# Vivado block design aurora_gty_vu13pto47dr, xcvu13p-fhgb2104-2-i, Vivado 2025.2
# (continued, part 2 of 4)
current_bd_instance /link_x1y4

create_bd_cell -type ip -vlnv xilinx.com:ip:axis_data_fifo:2.0 rx_fifo_c0
set_property -dict [list \
  CONFIG.HAS_AFULL 1 \
  CONFIG.HAS_TLAST 1 \
  CONFIG.HAS_WR_DATA_COUNT 1 \
  CONFIG.IS_ACLK_ASYNC 1 \
] [get_bd_cells rx_fifo_c0]
create_bd_cell -type ip -vlnv xilinx.com:ip:axis_data_fifo:2.0 rx_fifo_c1
set_property -dict [list \
  CONFIG.HAS_AFULL 1 \
  CONFIG.HAS_TLAST 1 \
  CONFIG.HAS_WR_DATA_COUNT 1 \
  CONFIG.IS_ACLK_ASYNC 1 \
] [get_bd_cells rx_fifo_c1]
create_bd_cell -type ip -vlnv xilinx.com:ip:axis_data_fifo:2.0 tx_fifo_c0
set_property -dict [list \
  CONFIG.HAS_AFULL 1 \
  CONFIG.HAS_TLAST 1 \
  CONFIG.HAS_WR_DATA_COUNT 1 \
  CONFIG.IS_ACLK_ASYNC 1 \
  CONFIG.TDATA_NUM_BYTES 16 \
] [get_bd_cells tx_fifo_c0]
create_bd_cell -type ip -vlnv xilinx.com:ip:axis_data_fifo:2.0 tx_fifo_c1
set_property -dict [list \
  CONFIG.HAS_AFULL 1 \
  CONFIG.HAS_TLAST 1 \
  CONFIG.HAS_WR_DATA_COUNT 1 \
  CONFIG.IS_ACLK_ASYNC 1 \
  CONFIG.TDATA_NUM_BYTES 16 \
] [get_bd_cells tx_fifo_c1]
create_bd_cell -type ip -vlnv xilinx.com:ip:axis_register_slice:1.1 tx_slice_c0
set_property -dict [list \
  CONFIG.NUM_SLR_CROSSINGS 2 \
  CONFIG.PIPELINES_MASTER 1 \
  CONFIG.PIPELINES_MIDDLE 1 \
  CONFIG.PIPELINES_SLAVE 1 \
  CONFIG.REG_CONFIG 15 \
] [get_bd_cells tx_slice_c0]
create_bd_cell -type ip -vlnv xilinx.com:ip:axis_register_slice:1.1 tx_slice_c1
set_property -dict [list \
  CONFIG.NUM_SLR_CROSSINGS 2 \
  CONFIG.PIPELINES_MASTER 1 \
  CONFIG.PIPELINES_MIDDLE 1 \
  CONFIG.PIPELINES_SLAVE 1 \
  CONFIG.REG_CONFIG 15 \
] [get_bd_cells tx_slice_c1]
create_bd_cell -type ip -vlnv xilinx.com:ip:axis_register_slice:1.1 rx_slice_c0
create_bd_cell -type ip -vlnv xilinx.com:ip:axis_register_slice:1.1 rx_slice_c1
create_bd_cell -type ip -vlnv xilinx.com:ip:xpm_cdc_gen:1.0 axis_rst_sync_c0
set_property -dict {CONFIG.CDC_TYPE xpm_cdc_async_rst} [get_bd_cells axis_rst_sync_c0]
create_bd_cell -type ip -vlnv xilinx.com:ip:xpm_cdc_gen:1.0 axis_rst_sync_c1
set_property -dict {CONFIG.CDC_TYPE xpm_cdc_async_rst} [get_bd_cells axis_rst_sync_c1]
create_bd_cell -type ip -vlnv xilinx.com:ip:xpm_cdc_gen:1.0 user_rst_sync_c1
set_property -dict {CONFIG.CDC_TYPE xpm_cdc_async_rst} [get_bd_cells user_rst_sync_c1]
create_bd_cell -type ip -vlnv xilinx.com:ip:xpm_cdc_gen:1.0 user_rst_sync_c0
set_property -dict {CONFIG.CDC_TYPE xpm_cdc_async_rst} [get_bd_cells user_rst_sync_c0]

# ---- hierarchy /link_x1y5 ----
current_bd_instance /link_x1y5
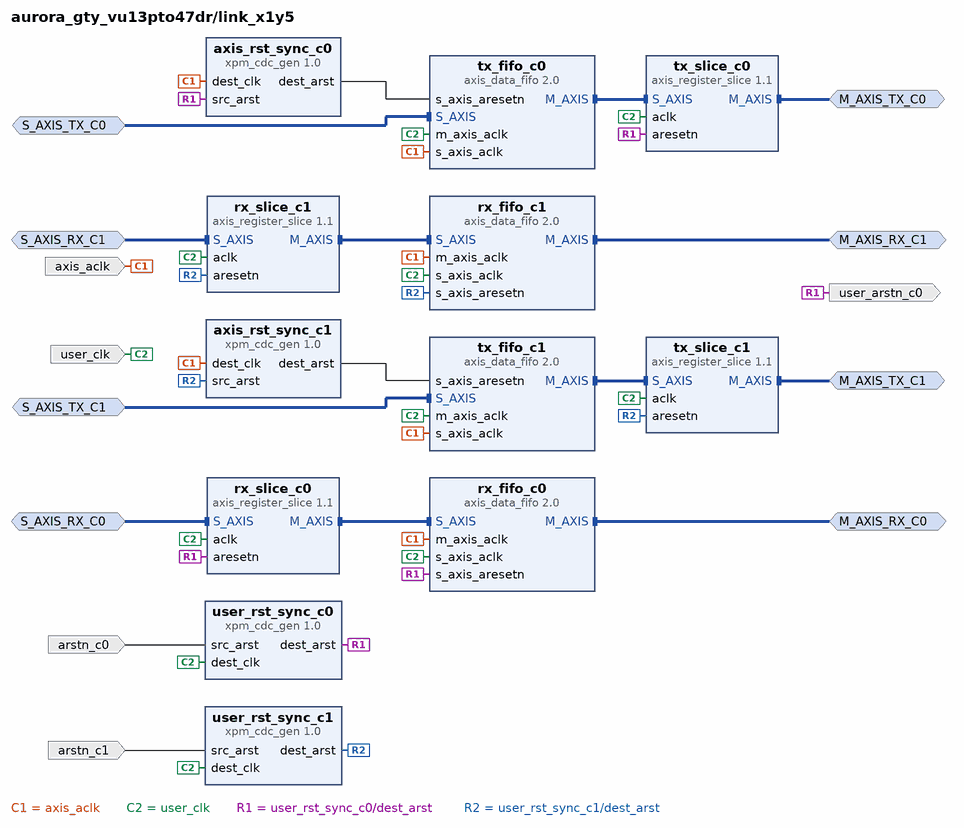
[diagram p10: block diagram inside /link_x1y5]
create_bd_intf_pin -mode Master -vlnv xilinx.com:interface:axis_rtl:1.0 M_AXIS_RX_C0
create_bd_intf_pin -mode Master -vlnv xilinx.com:interface:axis_rtl:1.0 M_AXIS_RX_C1
create_bd_intf_pin -mode Slave -vlnv xilinx.com:interface:axis_rtl:1.0 S_AXIS_TX_C0
create_bd_intf_pin -mode Slave -vlnv xilinx.com:interface:axis_rtl:1.0 S_AXIS_TX_C1
create_bd_intf_pin -mode Master -vlnv xilinx.com:interface:axis_rtl:1.0 M_AXIS_TX_C0
create_bd_intf_pin -mode Master -vlnv xilinx.com:interface:axis_rtl:1.0 M_AXIS_TX_C1
create_bd_intf_pin -mode Slave -vlnv xilinx.com:interface:axis_rtl:1.0 S_AXIS_RX_C0
create_bd_intf_pin -mode Slave -vlnv xilinx.com:interface:axis_rtl:1.0 S_AXIS_RX_C1
create_bd_pin -dir O user_arstn_c0
create_bd_pin -dir I -type clk user_clk
create_bd_pin -dir I -type clk axis_aclk
create_bd_pin -dir I arstn_c1
create_bd_pin -dir I arstn_c0

create_bd_cell -type ip -vlnv xilinx.com:ip:axis_data_fifo:2.0 rx_fifo_c0
set_property -dict [list \
  CONFIG.HAS_AFULL 1 \
  CONFIG.HAS_TLAST 1 \
  CONFIG.HAS_WR_DATA_COUNT 1 \
  CONFIG.IS_ACLK_ASYNC 1 \
] [get_bd_cells rx_fifo_c0]
create_bd_cell -type ip -vlnv xilinx.com:ip:axis_data_fifo:2.0 rx_fifo_c1
set_property -dict [list \
  CONFIG.HAS_AFULL 1 \
  CONFIG.HAS_TLAST 1 \
  CONFIG.HAS_WR_DATA_COUNT 1 \
  CONFIG.IS_ACLK_ASYNC 1 \
] [get_bd_cells rx_fifo_c1]
create_bd_cell -type ip -vlnv xilinx.com:ip:axis_data_fifo:2.0 tx_fifo_c0
set_property -dict [list \
  CONFIG.HAS_AFULL 1 \
  CONFIG.HAS_TLAST 1 \
  CONFIG.HAS_WR_DATA_COUNT 1 \
  CONFIG.IS_ACLK_ASYNC 1 \
  CONFIG.TDATA_NUM_BYTES 16 \
] [get_bd_cells tx_fifo_c0]
create_bd_cell -type ip -vlnv xilinx.com:ip:axis_data_fifo:2.0 tx_fifo_c1
set_property -dict [list \
  CONFIG.HAS_AFULL 1 \
  CONFIG.HAS_TLAST 1 \
  CONFIG.HAS_WR_DATA_COUNT 1 \
  CONFIG.IS_ACLK_ASYNC 1 \
  CONFIG.TDATA_NUM_BYTES 16 \
] [get_bd_cells tx_fifo_c1]
create_bd_cell -type ip -vlnv xilinx.com:ip:axis_register_slice:1.1 tx_slice_c0
set_property -dict [list \
  CONFIG.NUM_SLR_CROSSINGS 2 \
  CONFIG.PIPELINES_MASTER 1 \
  CONFIG.PIPELINES_MIDDLE 1 \
  CONFIG.PIPELINES_SLAVE 1 \
  CONFIG.REG_CONFIG 15 \
] [get_bd_cells tx_slice_c0]
create_bd_cell -type ip -vlnv xilinx.com:ip:axis_register_slice:1.1 tx_slice_c1
set_property -dict [list \
  CONFIG.NUM_SLR_CROSSINGS 2 \
  CONFIG.PIPELINES_MASTER 1 \
  CONFIG.PIPELINES_MIDDLE 1 \
  CONFIG.PIPELINES_SLAVE 1 \
  CONFIG.REG_CONFIG 15 \
] [get_bd_cells tx_slice_c1]
create_bd_cell -type ip -vlnv xilinx.com:ip:axis_register_slice:1.1 rx_slice_c0
create_bd_cell -type ip -vlnv xilinx.com:ip:axis_register_slice:1.1 rx_slice_c1
create_bd_cell -type ip -vlnv xilinx.com:ip:xpm_cdc_gen:1.0 axis_rst_sync_c0
set_property -dict {CONFIG.CDC_TYPE xpm_cdc_async_rst} [get_bd_cells axis_rst_sync_c0]
create_bd_cell -type ip -vlnv xilinx.com:ip:xpm_cdc_gen:1.0 axis_rst_sync_c1
set_property -dict {CONFIG.CDC_TYPE xpm_cdc_async_rst} [get_bd_cells axis_rst_sync_c1]
create_bd_cell -type ip -vlnv xilinx.com:ip:xpm_cdc_gen:1.0 user_rst_sync_c1
set_property -dict {CONFIG.CDC_TYPE xpm_cdc_async_rst} [get_bd_cells user_rst_sync_c1]
create_bd_cell -type ip -vlnv xilinx.com:ip:xpm_cdc_gen:1.0 user_rst_sync_c0
set_property -dict {CONFIG.CDC_TYPE xpm_cdc_async_rst} [get_bd_cells user_rst_sync_c0]

# ---- hierarchy /link_x1y6 ----
current_bd_instance /link_x1y6
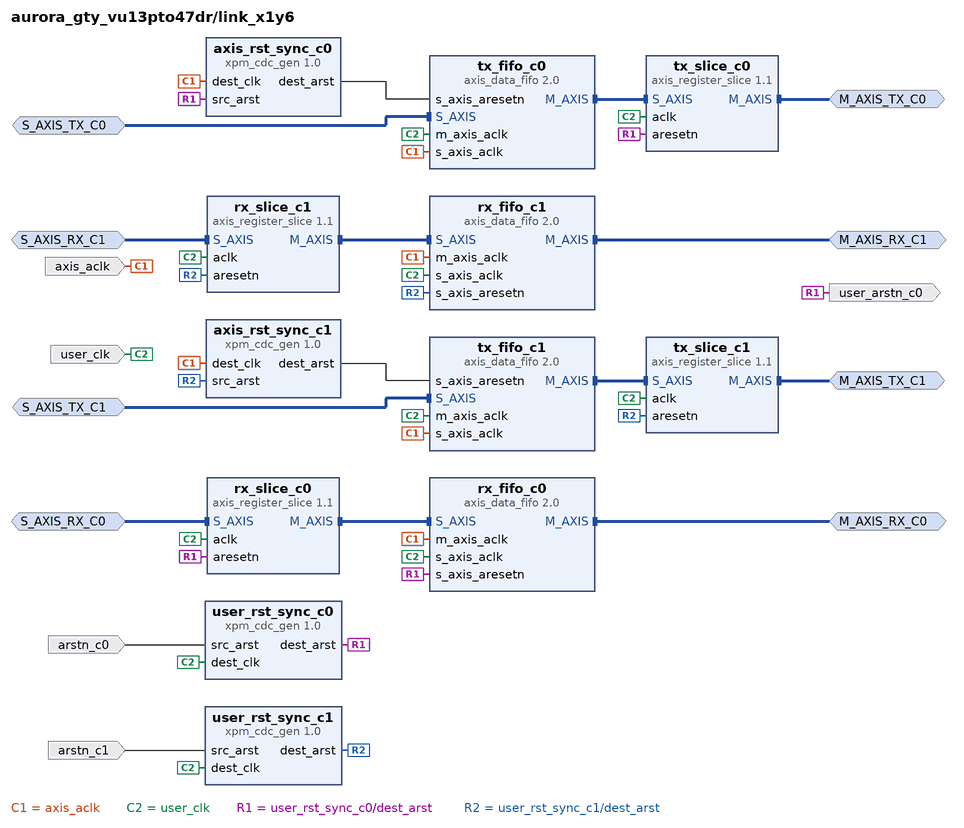
[diagram p11: block diagram inside /link_x1y6]
create_bd_intf_pin -mode Master -vlnv xilinx.com:interface:axis_rtl:1.0 M_AXIS_RX_C0
create_bd_intf_pin -mode Master -vlnv xilinx.com:interface:axis_rtl:1.0 M_AXIS_RX_C1
create_bd_intf_pin -mode Slave -vlnv xilinx.com:interface:axis_rtl:1.0 S_AXIS_TX_C0
create_bd_intf_pin -mode Slave -vlnv xilinx.com:interface:axis_rtl:1.0 S_AXIS_TX_C1
create_bd_intf_pin -mode Master -vlnv xilinx.com:interface:axis_rtl:1.0 M_AXIS_TX_C0
create_bd_intf_pin -mode Master -vlnv xilinx.com:interface:axis_rtl:1.0 M_AXIS_TX_C1
create_bd_intf_pin -mode Slave -vlnv xilinx.com:interface:axis_rtl:1.0 S_AXIS_RX_C0
create_bd_intf_pin -mode Slave -vlnv xilinx.com:interface:axis_rtl:1.0 S_AXIS_RX_C1
create_bd_pin -dir O user_arstn_c0
create_bd_pin -dir I -type clk user_clk
create_bd_pin -dir I -type clk axis_aclk
create_bd_pin -dir I arstn_c1
create_bd_pin -dir I arstn_c0

create_bd_cell -type ip -vlnv xilinx.com:ip:axis_data_fifo:2.0 rx_fifo_c0
set_property -dict [list \
  CONFIG.HAS_AFULL 1 \
  CONFIG.HAS_TLAST 1 \
  CONFIG.HAS_WR_DATA_COUNT 1 \
  CONFIG.IS_ACLK_ASYNC 1 \
] [get_bd_cells rx_fifo_c0]
create_bd_cell -type ip -vlnv xilinx.com:ip:axis_data_fifo:2.0 rx_fifo_c1
set_property -dict [list \
  CONFIG.HAS_AFULL 1 \
  CONFIG.HAS_TLAST 1 \
  CONFIG.HAS_WR_DATA_COUNT 1 \
  CONFIG.IS_ACLK_ASYNC 1 \
] [get_bd_cells rx_fifo_c1]
create_bd_cell -type ip -vlnv xilinx.com:ip:axis_data_fifo:2.0 tx_fifo_c0
set_property -dict [list \
  CONFIG.HAS_AFULL 1 \
  CONFIG.HAS_TLAST 1 \
  CONFIG.HAS_WR_DATA_COUNT 1 \
  CONFIG.IS_ACLK_ASYNC 1 \
  CONFIG.TDATA_NUM_BYTES 16 \
] [get_bd_cells tx_fifo_c0]
create_bd_cell -type ip -vlnv xilinx.com:ip:axis_data_fifo:2.0 tx_fifo_c1
set_property -dict [list \
  CONFIG.HAS_AFULL 1 \
  CONFIG.HAS_TLAST 1 \
  CONFIG.HAS_WR_DATA_COUNT 1 \
  CONFIG.IS_ACLK_ASYNC 1 \
  CONFIG.TDATA_NUM_BYTES 16 \
] [get_bd_cells tx_fifo_c1]
create_bd_cell -type ip -vlnv xilinx.com:ip:axis_register_slice:1.1 tx_slice_c0
set_property -dict [list \
  CONFIG.NUM_SLR_CROSSINGS 2 \
  CONFIG.PIPELINES_MASTER 1 \
  CONFIG.PIPELINES_MIDDLE 1 \
  CONFIG.PIPELINES_SLAVE 1 \
  CONFIG.REG_CONFIG 15 \
] [get_bd_cells tx_slice_c0]
create_bd_cell -type ip -vlnv xilinx.com:ip:axis_register_slice:1.1 tx_slice_c1
set_property -dict [list \
  CONFIG.NUM_SLR_CROSSINGS 2 \
  CONFIG.PIPELINES_MASTER 1 \
  CONFIG.PIPELINES_MIDDLE 1 \
  CONFIG.PIPELINES_SLAVE 1 \
  CONFIG.REG_CONFIG 15 \
] [get_bd_cells tx_slice_c1]
create_bd_cell -type ip -vlnv xilinx.com:ip:axis_register_slice:1.1 rx_slice_c0
create_bd_cell -type ip -vlnv xilinx.com:ip:axis_register_slice:1.1 rx_slice_c1
create_bd_cell -type ip -vlnv xilinx.com:ip:xpm_cdc_gen:1.0 axis_rst_sync_c0
set_property -dict {CONFIG.CDC_TYPE xpm_cdc_async_rst} [get_bd_cells axis_rst_sync_c0]
create_bd_cell -type ip -vlnv xilinx.com:ip:xpm_cdc_gen:1.0 axis_rst_sync_c1
set_property -dict {CONFIG.CDC_TYPE xpm_cdc_async_rst} [get_bd_cells axis_rst_sync_c1]
create_bd_cell -type ip -vlnv xilinx.com:ip:xpm_cdc_gen:1.0 user_rst_sync_c1
set_property -dict {CONFIG.CDC_TYPE xpm_cdc_async_rst} [get_bd_cells user_rst_sync_c1]
create_bd_cell -type ip -vlnv xilinx.com:ip:xpm_cdc_gen:1.0 user_rst_sync_c0
set_property -dict {CONFIG.CDC_TYPE xpm_cdc_async_rst} [get_bd_cells user_rst_sync_c0]

# ---- hierarchy /link_x1y7 ----
current_bd_instance /link_x1y7
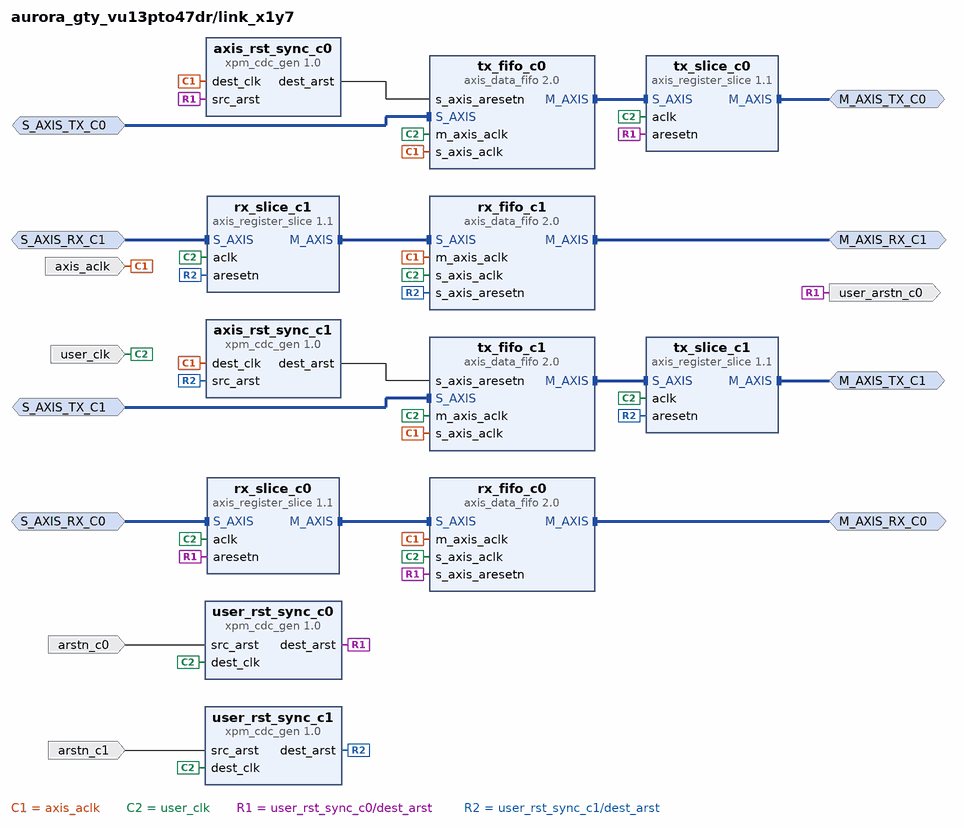
[diagram p12: block diagram inside /link_x1y7]
create_bd_intf_pin -mode Master -vlnv xilinx.com:interface:axis_rtl:1.0 M_AXIS_RX_C0
create_bd_intf_pin -mode Master -vlnv xilinx.com:interface:axis_rtl:1.0 M_AXIS_RX_C1
create_bd_intf_pin -mode Slave -vlnv xilinx.com:interface:axis_rtl:1.0 S_AXIS_TX_C0
create_bd_intf_pin -mode Slave -vlnv xilinx.com:interface:axis_rtl:1.0 S_AXIS_TX_C1
create_bd_intf_pin -mode Master -vlnv xilinx.com:interface:axis_rtl:1.0 M_AXIS_TX_C0
create_bd_intf_pin -mode Master -vlnv xilinx.com:interface:axis_rtl:1.0 M_AXIS_TX_C1
create_bd_intf_pin -mode Slave -vlnv xilinx.com:interface:axis_rtl:1.0 S_AXIS_RX_C0
create_bd_intf_pin -mode Slave -vlnv xilinx.com:interface:axis_rtl:1.0 S_AXIS_RX_C1
create_bd_pin -dir O user_arstn_c0
create_bd_pin -dir I -type clk user_clk
create_bd_pin -dir I -type clk axis_aclk
create_bd_pin -dir I arstn_c1
create_bd_pin -dir I arstn_c0

create_bd_cell -type ip -vlnv xilinx.com:ip:axis_data_fifo:2.0 rx_fifo_c0
set_property -dict [list \
  CONFIG.HAS_AFULL 1 \
  CONFIG.HAS_TLAST 1 \
  CONFIG.HAS_WR_DATA_COUNT 1 \
  CONFIG.IS_ACLK_ASYNC 1 \
] [get_bd_cells rx_fifo_c0]
create_bd_cell -type ip -vlnv xilinx.com:ip:axis_data_fifo:2.0 rx_fifo_c1
set_property -dict [list \
  CONFIG.HAS_AFULL 1 \
  CONFIG.HAS_TLAST 1 \
  CONFIG.HAS_WR_DATA_COUNT 1 \
  CONFIG.IS_ACLK_ASYNC 1 \
] [get_bd_cells rx_fifo_c1]
create_bd_cell -type ip -vlnv xilinx.com:ip:axis_data_fifo:2.0 tx_fifo_c0
set_property -dict [list \
  CONFIG.HAS_AFULL 1 \
  CONFIG.HAS_TLAST 1 \
  CONFIG.HAS_WR_DATA_COUNT 1 \
  CONFIG.IS_ACLK_ASYNC 1 \
  CONFIG.TDATA_NUM_BYTES 16 \
] [get_bd_cells tx_fifo_c0]
create_bd_cell -type ip -vlnv xilinx.com:ip:axis_data_fifo:2.0 tx_fifo_c1
set_property -dict [list \
  CONFIG.HAS_AFULL 1 \
  CONFIG.HAS_TLAST 1 \
  CONFIG.HAS_WR_DATA_COUNT 1 \
  CONFIG.IS_ACLK_ASYNC 1 \
  CONFIG.TDATA_NUM_BYTES 16 \
] [get_bd_cells tx_fifo_c1]
create_bd_cell -type ip -vlnv xilinx.com:ip:axis_register_slice:1.1 tx_slice_c0
set_property -dict [list \
  CONFIG.NUM_SLR_CROSSINGS 2 \
  CONFIG.PIPELINES_MASTER 1 \
  CONFIG.PIPELINES_MIDDLE 1 \
  CONFIG.PIPELINES_SLAVE 1 \
  CONFIG.REG_CONFIG 15 \
] [get_bd_cells tx_slice_c0]
create_bd_cell -type ip -vlnv xilinx.com:ip:axis_register_slice:1.1 tx_slice_c1
set_property -dict [list \
  CONFIG.NUM_SLR_CROSSINGS 2 \
  CONFIG.PIPELINES_MASTER 1 \
  CONFIG.PIPELINES_MIDDLE 1 \
  CONFIG.PIPELINES_SLAVE 1 \
  CONFIG.REG_CONFIG 15 \
] [get_bd_cells tx_slice_c1]
create_bd_cell -type ip -vlnv xilinx.com:ip:axis_register_slice:1.1 rx_slice_c0
create_bd_cell -type ip -vlnv xilinx.com:ip:axis_register_slice:1.1 rx_slice_c1
create_bd_cell -type ip -vlnv xilinx.com:ip:xpm_cdc_gen:1.0 axis_rst_sync_c0
set_property -dict {CONFIG.CDC_TYPE xpm_cdc_async_rst} [get_bd_cells axis_rst_sync_c0]
create_bd_cell -type ip -vlnv xilinx.com:ip:xpm_cdc_gen:1.0 axis_rst_sync_c1
set_property -dict {CONFIG.CDC_TYPE xpm_cdc_async_rst} [get_bd_cells axis_rst_sync_c1]
create_bd_cell -type ip -vlnv xilinx.com:ip:xpm_cdc_gen:1.0 user_rst_sync_c1
set_property -dict {CONFIG.CDC_TYPE xpm_cdc_async_rst} [get_bd_cells user_rst_sync_c1]
create_bd_cell -type ip -vlnv xilinx.com:ip:xpm_cdc_gen:1.0 user_rst_sync_c0
set_property -dict {CONFIG.CDC_TYPE xpm_cdc_async_rst} [get_bd_cells user_rst_sync_c0]

# ---- hierarchy /link_x1y8 ----
current_bd_instance /link_x1y8
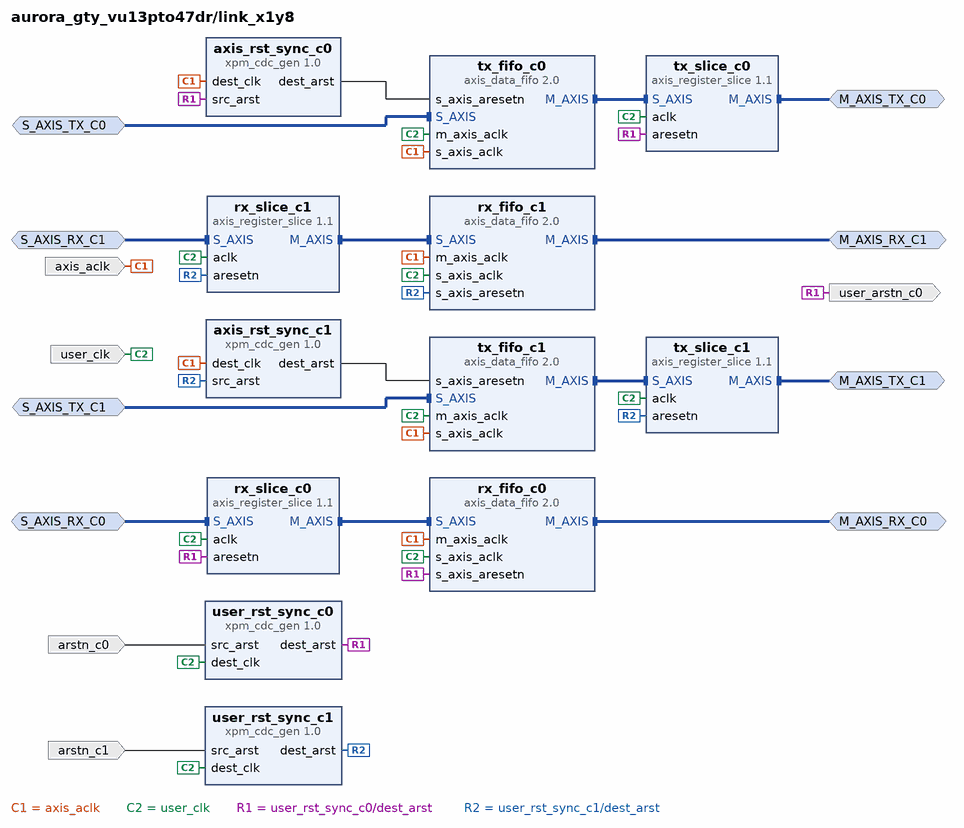
[diagram p13: block diagram inside /link_x1y8]
create_bd_intf_pin -mode Master -vlnv xilinx.com:interface:axis_rtl:1.0 M_AXIS_RX_C0
create_bd_intf_pin -mode Master -vlnv xilinx.com:interface:axis_rtl:1.0 M_AXIS_RX_C1
create_bd_intf_pin -mode Slave -vlnv xilinx.com:interface:axis_rtl:1.0 S_AXIS_TX_C0
create_bd_intf_pin -mode Slave -vlnv xilinx.com:interface:axis_rtl:1.0 S_AXIS_TX_C1
create_bd_intf_pin -mode Master -vlnv xilinx.com:interface:axis_rtl:1.0 M_AXIS_TX_C0
create_bd_intf_pin -mode Master -vlnv xilinx.com:interface:axis_rtl:1.0 M_AXIS_TX_C1
create_bd_intf_pin -mode Slave -vlnv xilinx.com:interface:axis_rtl:1.0 S_AXIS_RX_C0
create_bd_intf_pin -mode Slave -vlnv xilinx.com:interface:axis_rtl:1.0 S_AXIS_RX_C1
create_bd_pin -dir O user_arstn_c0
create_bd_pin -dir I -type clk user_clk
create_bd_pin -dir I -type clk axis_aclk
create_bd_pin -dir I arstn_c1
create_bd_pin -dir I arstn_c0

create_bd_cell -type ip -vlnv xilinx.com:ip:axis_data_fifo:2.0 rx_fifo_c0
set_property -dict [list \
  CONFIG.HAS_AFULL 1 \
  CONFIG.HAS_TLAST 1 \
  CONFIG.HAS_WR_DATA_COUNT 1 \
  CONFIG.IS_ACLK_ASYNC 1 \
] [get_bd_cells rx_fifo_c0]
create_bd_cell -type ip -vlnv xilinx.com:ip:axis_data_fifo:2.0 rx_fifo_c1
set_property -dict [list \
  CONFIG.HAS_AFULL 1 \
  CONFIG.HAS_TLAST 1 \
  CONFIG.HAS_WR_DATA_COUNT 1 \
  CONFIG.IS_ACLK_ASYNC 1 \
] [get_bd_cells rx_fifo_c1]
create_bd_cell -type ip -vlnv xilinx.com:ip:axis_data_fifo:2.0 tx_fifo_c0
set_property -dict [list \
  CONFIG.HAS_AFULL 1 \
  CONFIG.HAS_TLAST 1 \
  CONFIG.HAS_WR_DATA_COUNT 1 \
  CONFIG.IS_ACLK_ASYNC 1 \
  CONFIG.TDATA_NUM_BYTES 16 \
] [get_bd_cells tx_fifo_c0]
create_bd_cell -type ip -vlnv xilinx.com:ip:axis_data_fifo:2.0 tx_fifo_c1
set_property -dict [list \
  CONFIG.HAS_AFULL 1 \
  CONFIG.HAS_TLAST 1 \
  CONFIG.HAS_WR_DATA_COUNT 1 \
  CONFIG.IS_ACLK_ASYNC 1 \
  CONFIG.TDATA_NUM_BYTES 16 \
] [get_bd_cells tx_fifo_c1]
create_bd_cell -type ip -vlnv xilinx.com:ip:axis_register_slice:1.1 tx_slice_c0
set_property -dict [list \
  CONFIG.NUM_SLR_CROSSINGS 2 \
  CONFIG.PIPELINES_MASTER 1 \
  CONFIG.PIPELINES_MIDDLE 1 \
  CONFIG.PIPELINES_SLAVE 1 \
  CONFIG.REG_CONFIG 15 \
] [get_bd_cells tx_slice_c0]
create_bd_cell -type ip -vlnv xilinx.com:ip:axis_register_slice:1.1 tx_slice_c1
set_property -dict [list \
  CONFIG.NUM_SLR_CROSSINGS 2 \
  CONFIG.PIPELINES_MASTER 1 \
  CONFIG.PIPELINES_MIDDLE 1 \
  CONFIG.PIPELINES_SLAVE 1 \
  CONFIG.REG_CONFIG 15 \
] [get_bd_cells tx_slice_c1]
create_bd_cell -type ip -vlnv xilinx.com:ip:axis_register_slice:1.1 rx_slice_c0
create_bd_cell -type ip -vlnv xilinx.com:ip:axis_register_slice:1.1 rx_slice_c1
create_bd_cell -type ip -vlnv xilinx.com:ip:xpm_cdc_gen:1.0 axis_rst_sync_c0
set_property -dict {CONFIG.CDC_TYPE xpm_cdc_async_rst} [get_bd_cells axis_rst_sync_c0]
create_bd_cell -type ip -vlnv xilinx.com:ip:xpm_cdc_gen:1.0 axis_rst_sync_c1
set_property -dict {CONFIG.CDC_TYPE xpm_cdc_async_rst} [get_bd_cells axis_rst_sync_c1]
create_bd_cell -type ip -vlnv xilinx.com:ip:xpm_cdc_gen:1.0 user_rst_sync_c1
set_property -dict {CONFIG.CDC_TYPE xpm_cdc_async_rst} [get_bd_cells user_rst_sync_c1]
create_bd_cell -type ip -vlnv xilinx.com:ip:xpm_cdc_gen:1.0 user_rst_sync_c0
set_property -dict {CONFIG.CDC_TYPE xpm_cdc_async_rst} [get_bd_cells user_rst_sync_c0]

# ---- hierarchy /link_x1y9 ----
current_bd_instance /link_x1y9
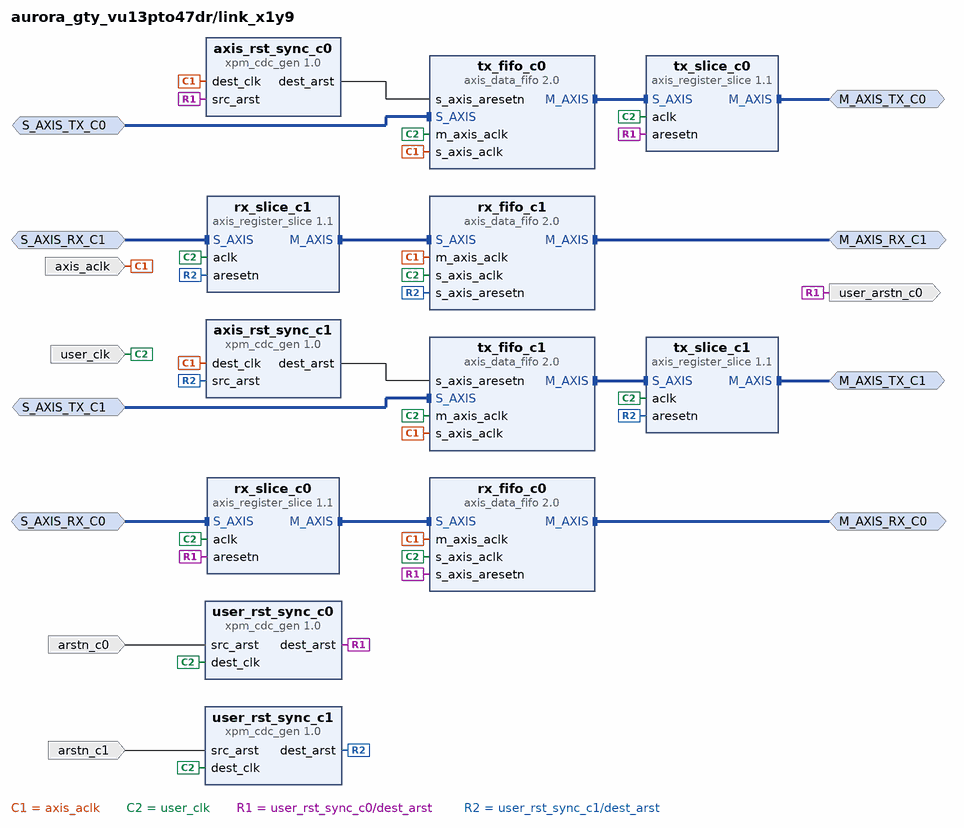
[diagram p14: block diagram inside /link_x1y9]
create_bd_intf_pin -mode Master -vlnv xilinx.com:interface:axis_rtl:1.0 M_AXIS_RX_C0
create_bd_intf_pin -mode Master -vlnv xilinx.com:interface:axis_rtl:1.0 M_AXIS_RX_C1
create_bd_intf_pin -mode Slave -vlnv xilinx.com:interface:axis_rtl:1.0 S_AXIS_TX_C0
create_bd_intf_pin -mode Slave -vlnv xilinx.com:interface:axis_rtl:1.0 S_AXIS_TX_C1
create_bd_intf_pin -mode Master -vlnv xilinx.com:interface:axis_rtl:1.0 M_AXIS_TX_C0
create_bd_intf_pin -mode Master -vlnv xilinx.com:interface:axis_rtl:1.0 M_AXIS_TX_C1
create_bd_intf_pin -mode Slave -vlnv xilinx.com:interface:axis_rtl:1.0 S_AXIS_RX_C0
create_bd_intf_pin -mode Slave -vlnv xilinx.com:interface:axis_rtl:1.0 S_AXIS_RX_C1
create_bd_pin -dir O user_arstn_c0
create_bd_pin -dir I -type clk user_clk
create_bd_pin -dir I -type clk axis_aclk
create_bd_pin -dir I arstn_c1
create_bd_pin -dir I arstn_c0

create_bd_cell -type ip -vlnv xilinx.com:ip:axis_data_fifo:2.0 rx_fifo_c0
set_property -dict [list \
  CONFIG.HAS_AFULL 1 \
  CONFIG.HAS_TLAST 1 \
  CONFIG.HAS_WR_DATA_COUNT 1 \
  CONFIG.IS_ACLK_ASYNC 1 \
] [get_bd_cells rx_fifo_c0]
create_bd_cell -type ip -vlnv xilinx.com:ip:axis_data_fifo:2.0 rx_fifo_c1
set_property -dict [list \
  CONFIG.HAS_AFULL 1 \
  CONFIG.HAS_TLAST 1 \
  CONFIG.HAS_WR_DATA_COUNT 1 \
  CONFIG.IS_ACLK_ASYNC 1 \
] [get_bd_cells rx_fifo_c1]
create_bd_cell -type ip -vlnv xilinx.com:ip:axis_data_fifo:2.0 tx_fifo_c0
set_property -dict [list \
  CONFIG.HAS_AFULL 1 \
  CONFIG.HAS_TLAST 1 \
  CONFIG.HAS_WR_DATA_COUNT 1 \
  CONFIG.IS_ACLK_ASYNC 1 \
  CONFIG.TDATA_NUM_BYTES 16 \
] [get_bd_cells tx_fifo_c0]
create_bd_cell -type ip -vlnv xilinx.com:ip:axis_data_fifo:2.0 tx_fifo_c1
set_property -dict [list \
  CONFIG.HAS_AFULL 1 \
  CONFIG.HAS_TLAST 1 \
  CONFIG.HAS_WR_DATA_COUNT 1 \
  CONFIG.IS_ACLK_ASYNC 1 \
  CONFIG.TDATA_NUM_BYTES 16 \
] [get_bd_cells tx_fifo_c1]
create_bd_cell -type ip -vlnv xilinx.com:ip:axis_register_slice:1.1 tx_slice_c0
set_property -dict [list \
  CONFIG.NUM_SLR_CROSSINGS 2 \
  CONFIG.PIPELINES_MASTER 1 \
  CONFIG.PIPELINES_MIDDLE 1 \
  CONFIG.PIPELINES_SLAVE 1 \
  CONFIG.REG_CONFIG 15 \
] [get_bd_cells tx_slice_c0]
create_bd_cell -type ip -vlnv xilinx.com:ip:axis_register_slice:1.1 tx_slice_c1
set_property -dict [list \
  CONFIG.NUM_SLR_CROSSINGS 2 \
  CONFIG.PIPELINES_MASTER 1 \
  CONFIG.PIPELINES_MIDDLE 1 \
  CONFIG.PIPELINES_SLAVE 1 \
  CONFIG.REG_CONFIG 15 \
] [get_bd_cells tx_slice_c1]
create_bd_cell -type ip -vlnv xilinx.com:ip:axis_register_slice:1.1 rx_slice_c0
create_bd_cell -type ip -vlnv xilinx.com:ip:axis_register_slice:1.1 rx_slice_c1
create_bd_cell -type ip -vlnv xilinx.com:ip:xpm_cdc_gen:1.0 axis_rst_sync_c0
set_property -dict {CONFIG.CDC_TYPE xpm_cdc_async_rst} [get_bd_cells axis_rst_sync_c0]
create_bd_cell -type ip -vlnv xilinx.com:ip:xpm_cdc_gen:1.0 axis_rst_sync_c1
set_property -dict {CONFIG.CDC_TYPE xpm_cdc_async_rst} [get_bd_cells axis_rst_sync_c1]
create_bd_cell -type ip -vlnv xilinx.com:ip:xpm_cdc_gen:1.0 user_rst_sync_c1
set_property -dict {CONFIG.CDC_TYPE xpm_cdc_async_rst} [get_bd_cells user_rst_sync_c1]
create_bd_cell -type ip -vlnv xilinx.com:ip:xpm_cdc_gen:1.0 user_rst_sync_c0
set_property -dict {CONFIG.CDC_TYPE xpm_cdc_async_rst} [get_bd_cells user_rst_sync_c0]

# ---- hierarchy /link_x1y10 ----
current_bd_instance /link_x1y10
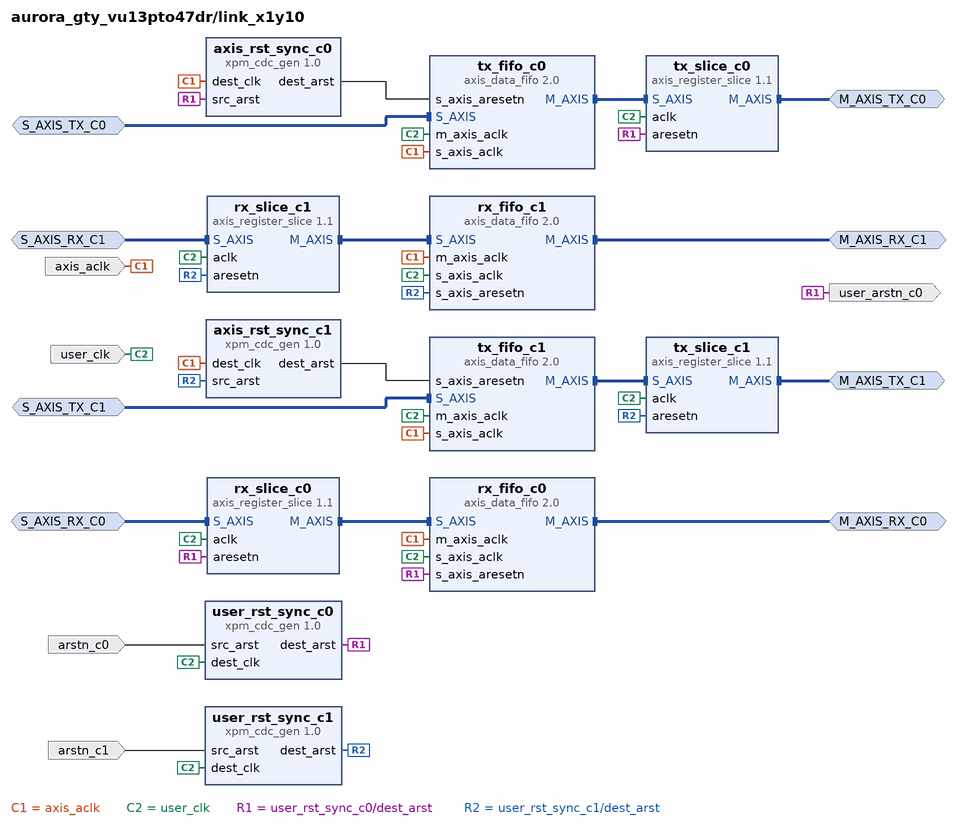
[diagram p15: block diagram inside /link_x1y10]
create_bd_intf_pin -mode Master -vlnv xilinx.com:interface:axis_rtl:1.0 M_AXIS_RX_C0
create_bd_intf_pin -mode Master -vlnv xilinx.com:interface:axis_rtl:1.0 M_AXIS_RX_C1
create_bd_intf_pin -mode Slave -vlnv xilinx.com:interface:axis_rtl:1.0 S_AXIS_TX_C0
create_bd_intf_pin -mode Slave -vlnv xilinx.com:interface:axis_rtl:1.0 S_AXIS_TX_C1
create_bd_intf_pin -mode Master -vlnv xilinx.com:interface:axis_rtl:1.0 M_AXIS_TX_C0
create_bd_intf_pin -mode Master -vlnv xilinx.com:interface:axis_rtl:1.0 M_AXIS_TX_C1
create_bd_intf_pin -mode Slave -vlnv xilinx.com:interface:axis_rtl:1.0 S_AXIS_RX_C0
create_bd_intf_pin -mode Slave -vlnv xilinx.com:interface:axis_rtl:1.0 S_AXIS_RX_C1
create_bd_pin -dir O user_arstn_c0
create_bd_pin -dir I -type clk user_clk
create_bd_pin -dir I -type clk axis_aclk
create_bd_pin -dir I arstn_c1
create_bd_pin -dir I arstn_c0

create_bd_cell -type ip -vlnv xilinx.com:ip:axis_data_fifo:2.0 rx_fifo_c0
set_property -dict [list \
  CONFIG.HAS_AFULL 1 \
  CONFIG.HAS_TLAST 1 \
  CONFIG.HAS_WR_DATA_COUNT 1 \
  CONFIG.IS_ACLK_ASYNC 1 \
] [get_bd_cells rx_fifo_c0]
create_bd_cell -type ip -vlnv xilinx.com:ip:axis_data_fifo:2.0 rx_fifo_c1
set_property -dict [list \
  CONFIG.HAS_AFULL 1 \
  CONFIG.HAS_TLAST 1 \
  CONFIG.HAS_WR_DATA_COUNT 1 \
  CONFIG.IS_ACLK_ASYNC 1 \
] [get_bd_cells rx_fifo_c1]
create_bd_cell -type ip -vlnv xilinx.com:ip:axis_data_fifo:2.0 tx_fifo_c0
set_property -dict [list \
  CONFIG.HAS_AFULL 1 \
  CONFIG.HAS_TLAST 1 \
  CONFIG.HAS_WR_DATA_COUNT 1 \
  CONFIG.IS_ACLK_ASYNC 1 \
  CONFIG.TDATA_NUM_BYTES 16 \
] [get_bd_cells tx_fifo_c0]
create_bd_cell -type ip -vlnv xilinx.com:ip:axis_data_fifo:2.0 tx_fifo_c1
set_property -dict [list \
  CONFIG.HAS_AFULL 1 \
  CONFIG.HAS_TLAST 1 \
  CONFIG.HAS_WR_DATA_COUNT 1 \
  CONFIG.IS_ACLK_ASYNC 1 \
  CONFIG.TDATA_NUM_BYTES 16 \
] [get_bd_cells tx_fifo_c1]
create_bd_cell -type ip -vlnv xilinx.com:ip:axis_register_slice:1.1 tx_slice_c0
set_property -dict [list \
  CONFIG.NUM_SLR_CROSSINGS 2 \
  CONFIG.PIPELINES_MASTER 1 \
  CONFIG.PIPELINES_MIDDLE 1 \
  CONFIG.PIPELINES_SLAVE 1 \
  CONFIG.REG_CONFIG 15 \
] [get_bd_cells tx_slice_c0]
create_bd_cell -type ip -vlnv xilinx.com:ip:axis_register_slice:1.1 tx_slice_c1
set_property -dict [list \
  CONFIG.NUM_SLR_CROSSINGS 2 \
  CONFIG.PIPELINES_MASTER 1 \
  CONFIG.PIPELINES_MIDDLE 1 \
  CONFIG.PIPELINES_SLAVE 1 \
  CONFIG.REG_CONFIG 15 \
] [get_bd_cells tx_slice_c1]
create_bd_cell -type ip -vlnv xilinx.com:ip:axis_register_slice:1.1 rx_slice_c0
create_bd_cell -type ip -vlnv xilinx.com:ip:axis_register_slice:1.1 rx_slice_c1
create_bd_cell -type ip -vlnv xilinx.com:ip:xpm_cdc_gen:1.0 axis_rst_sync_c0
set_property -dict {CONFIG.CDC_TYPE xpm_cdc_async_rst} [get_bd_cells axis_rst_sync_c0]
create_bd_cell -type ip -vlnv xilinx.com:ip:xpm_cdc_gen:1.0 axis_rst_sync_c1
set_property -dict {CONFIG.CDC_TYPE xpm_cdc_async_rst} [get_bd_cells axis_rst_sync_c1]
create_bd_cell -type ip -vlnv xilinx.com:ip:xpm_cdc_gen:1.0 user_rst_sync_c1
set_property -dict {CONFIG.CDC_TYPE xpm_cdc_async_rst} [get_bd_cells user_rst_sync_c1]
create_bd_cell -type ip -vlnv xilinx.com:ip:xpm_cdc_gen:1.0 user_rst_sync_c0
set_property -dict {CONFIG.CDC_TYPE xpm_cdc_async_rst} [get_bd_cells user_rst_sync_c0]

# ---- hierarchy /link_x1y11 ----
current_bd_instance /link_x1y11
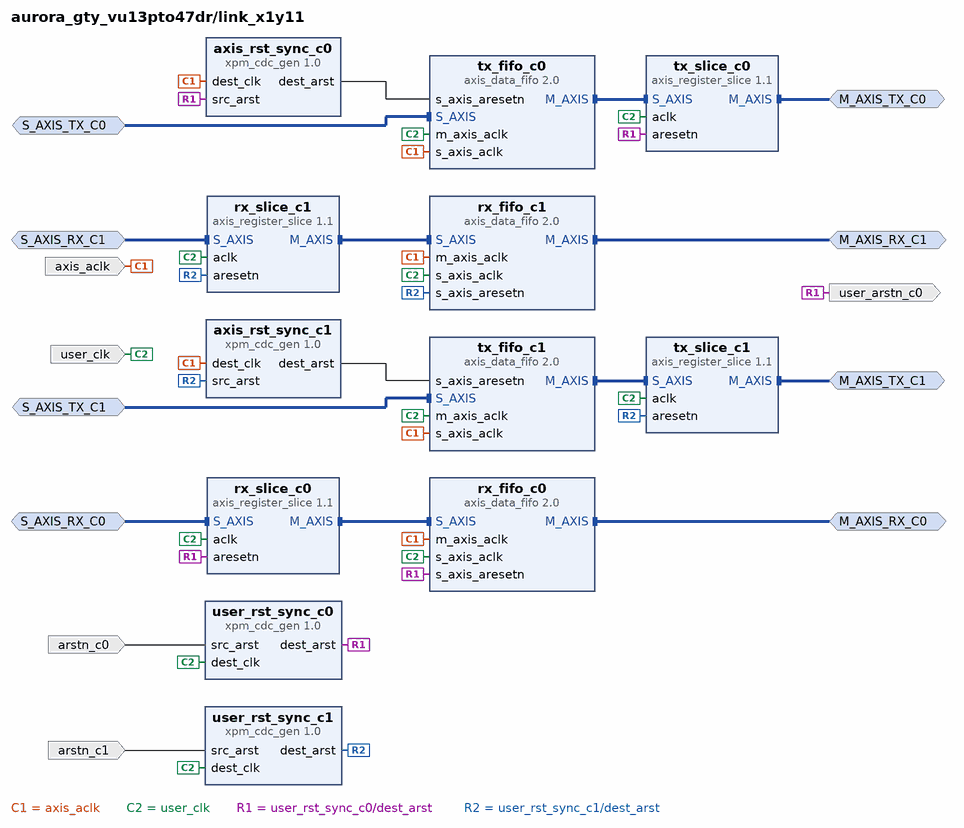
[diagram p16: block diagram inside /link_x1y11]
create_bd_intf_pin -mode Master -vlnv xilinx.com:interface:axis_rtl:1.0 M_AXIS_RX_C0
create_bd_intf_pin -mode Master -vlnv xilinx.com:interface:axis_rtl:1.0 M_AXIS_RX_C1
create_bd_intf_pin -mode Slave -vlnv xilinx.com:interface:axis_rtl:1.0 S_AXIS_TX_C0
create_bd_intf_pin -mode Slave -vlnv xilinx.com:interface:axis_rtl:1.0 S_AXIS_TX_C1
create_bd_intf_pin -mode Master -vlnv xilinx.com:interface:axis_rtl:1.0 M_AXIS_TX_C0
create_bd_intf_pin -mode Master -vlnv xilinx.com:interface:axis_rtl:1.0 M_AXIS_TX_C1
create_bd_intf_pin -mode Slave -vlnv xilinx.com:interface:axis_rtl:1.0 S_AXIS_RX_C0
create_bd_intf_pin -mode Slave -vlnv xilinx.com:interface:axis_rtl:1.0 S_AXIS_RX_C1
create_bd_pin -dir O user_arstn_c0
create_bd_pin -dir I -type clk user_clk
create_bd_pin -dir I -type clk axis_aclk
create_bd_pin -dir I arstn_c1
create_bd_pin -dir I arstn_c0

create_bd_cell -type ip -vlnv xilinx.com:ip:axis_data_fifo:2.0 rx_fifo_c0
set_property -dict [list \
  CONFIG.HAS_AFULL 1 \
  CONFIG.HAS_TLAST 1 \
  CONFIG.HAS_WR_DATA_COUNT 1 \
  CONFIG.IS_ACLK_ASYNC 1 \
] [get_bd_cells rx_fifo_c0]
create_bd_cell -type ip -vlnv xilinx.com:ip:axis_data_fifo:2.0 rx_fifo_c1
set_property -dict [list \
  CONFIG.HAS_AFULL 1 \
  CONFIG.HAS_TLAST 1 \
  CONFIG.HAS_WR_DATA_COUNT 1 \
  CONFIG.IS_ACLK_ASYNC 1 \
] [get_bd_cells rx_fifo_c1]
create_bd_cell -type ip -vlnv xilinx.com:ip:axis_data_fifo:2.0 tx_fifo_c0
set_property -dict [list \
  CONFIG.HAS_AFULL 1 \
  CONFIG.HAS_TLAST 1 \
  CONFIG.HAS_WR_DATA_COUNT 1 \
  CONFIG.IS_ACLK_ASYNC 1 \
  CONFIG.TDATA_NUM_BYTES 16 \
] [get_bd_cells tx_fifo_c0]
create_bd_cell -type ip -vlnv xilinx.com:ip:axis_data_fifo:2.0 tx_fifo_c1
set_property -dict [list \
  CONFIG.HAS_AFULL 1 \
  CONFIG.HAS_TLAST 1 \
  CONFIG.HAS_WR_DATA_COUNT 1 \
  CONFIG.IS_ACLK_ASYNC 1 \
  CONFIG.TDATA_NUM_BYTES 16 \
] [get_bd_cells tx_fifo_c1]
create_bd_cell -type ip -vlnv xilinx.com:ip:axis_register_slice:1.1 tx_slice_c0
set_property -dict [list \
  CONFIG.NUM_SLR_CROSSINGS 2 \
  CONFIG.PIPELINES_MASTER 1 \
  CONFIG.PIPELINES_MIDDLE 1 \
  CONFIG.PIPELINES_SLAVE 1 \
  CONFIG.REG_CONFIG 15 \
] [get_bd_cells tx_slice_c0]
create_bd_cell -type ip -vlnv xilinx.com:ip:axis_register_slice:1.1 tx_slice_c1
set_property -dict [list \
  CONFIG.NUM_SLR_CROSSINGS 2 \
  CONFIG.PIPELINES_MASTER 1 \
  CONFIG.PIPELINES_MIDDLE 1 \
  CONFIG.PIPELINES_SLAVE 1 \
  CONFIG.REG_CONFIG 15 \
] [get_bd_cells tx_slice_c1]
create_bd_cell -type ip -vlnv xilinx.com:ip:axis_register_slice:1.1 rx_slice_c0
create_bd_cell -type ip -vlnv xilinx.com:ip:axis_register_slice:1.1 rx_slice_c1
create_bd_cell -type ip -vlnv xilinx.com:ip:xpm_cdc_gen:1.0 axis_rst_sync_c0
set_property -dict {CONFIG.CDC_TYPE xpm_cdc_async_rst} [get_bd_cells axis_rst_sync_c0]
create_bd_cell -type ip -vlnv xilinx.com:ip:xpm_cdc_gen:1.0 axis_rst_sync_c1
set_property -dict {CONFIG.CDC_TYPE xpm_cdc_async_rst} [get_bd_cells axis_rst_sync_c1]
create_bd_cell -type ip -vlnv xilinx.com:ip:xpm_cdc_gen:1.0 user_rst_sync_c1
set_property -dict {CONFIG.CDC_TYPE xpm_cdc_async_rst} [get_bd_cells user_rst_sync_c1]
create_bd_cell -type ip -vlnv xilinx.com:ip:xpm_cdc_gen:1.0 user_rst_sync_c0
set_property -dict {CONFIG.CDC_TYPE xpm_cdc_async_rst} [get_bd_cells user_rst_sync_c0]

# ---- connections ----

current_bd_instance /hier_x1y4
connect_bd_intf_net [get_bd_intf_pins GT_REFCLK] [get_bd_intf_pins aurora_x1y4_0/GT_DIFF_REFCLK1]
connect_bd_intf_net [get_bd_intf_pins GT_SERIAL_RX_C0] [get_bd_intf_pins aurora_x1y4_0/GT_SERIAL_RX]
connect_bd_intf_net [get_bd_intf_pins GT_SERIAL_RX_C1] [get_bd_intf_pins aurora_x1y4_1/GT_SERIAL_RX]
connect_bd_intf_net [get_bd_intf_pins S_AXIS_TX_C0] [get_bd_intf_pins aurora_x1y4_0/USER_DATA_S_AXIS_TX]
connect_bd_intf_net [get_bd_intf_pins S_AXIS_TX_C1] [get_bd_intf_pins aurora_x1y4_1/USER_DATA_S_AXIS_TX]
connect_bd_intf_net [get_bd_intf_pins GT_SERIAL_TX_C0] [get_bd_intf_pins aurora_x1y4_0/GT_SERIAL_TX]
connect_bd_intf_net [get_bd_intf_pins M_AXIS_RX_C0] [get_bd_intf_pins aurora_x1y4_0/USER_DATA_M_AXIS_RX]
connect_bd_intf_net [get_bd_intf_pins GT_SERIAL_TX_C1] [get_bd_intf_pins aurora_x1y4_1/GT_SERIAL_TX]
connect_bd_intf_net [get_bd_intf_pins M_AXIS_RX_C1] [get_bd_intf_pins aurora_x1y4_1/USER_DATA_M_AXIS_RX]
connect_bd_net [get_bd_pins aurora_rstn_0/arstn] [get_bd_pins arstn_c0]
connect_bd_net [get_bd_pins aurora_rstn_1/arstn] [get_bd_pins arstn_c1]
connect_bd_net [get_bd_pins aurora_x1y4_0/channel_up] [get_bd_pins x1y4_core_status_0/probe_in0] [get_bd_pins aurora_rstn_0/channel_up]
connect_bd_net [get_bd_pins aurora_x1y4_0/gt_pll_lock] [get_bd_pins x1y4_core_status_0/probe_in1] [get_bd_pins auto_reset_aurora/pll_lock]
connect_bd_net [get_bd_pins aurora_x1y4_0/gt_qpllclk_quad1_out] [get_bd_pins aurora_x1y4_1/gt_qpllclk_quad1_in]
connect_bd_net [get_bd_pins aurora_x1y4_0/gt_qplllock_quad1_out] [get_bd_pins aurora_x1y4_1/gt_qplllock_quad1_in]
connect_bd_net [get_bd_pins aurora_x1y4_0/gt_qpllrefclk_quad1_out] [get_bd_pins aurora_x1y4_1/gt_qpllrefclk_quad1_in]
connect_bd_net [get_bd_pins aurora_x1y4_0/gt_qpllrefclklost_quad1_out] [get_bd_pins aurora_x1y4_1/gt_qpllrefclklost_quad1]
connect_bd_net [get_bd_pins aurora_x1y4_0/gt_refclk1_out] [get_bd_pins aurora_x1y4_1/refclk1_in]
connect_bd_net [get_bd_pins aurora_x1y4_0/gt_reset_out] [get_bd_pins aurora_x1y4_1/pma_init]
connect_bd_net [get_bd_pins aurora_x1y4_0/lane_up] [get_bd_pins x1y4_core_status_0/probe_in2]
connect_bd_net [get_bd_pins aurora_x1y4_0/mmcm_not_locked_out] [get_bd_pins aurora_x1y4_1/mmcm_not_locked]
connect_bd_net [get_bd_pins aurora_x1y4_0/sync_clk_out] [get_bd_pins aurora_x1y4_1/sync_clk]
connect_bd_net [get_bd_pins aurora_x1y4_0/sys_reset_out] [get_bd_pins aurora_x1y4_1/reset_pb] [get_bd_pins aurora_rstn_0/system_rst]
connect_bd_net [get_bd_pins aurora_x1y4_0/user_clk_out] \
  [get_bd_pins user_clk_out] [get_bd_pins x1y4_core_status_0/clk] [get_bd_pins x1y4_core_status_1/clk] \
  [get_bd_pins aurora_x1y4_1/user_clk]
connect_bd_net [get_bd_pins aurora_x1y4_1/channel_up] [get_bd_pins x1y4_core_status_1/probe_in0] [get_bd_pins aurora_rstn_1/channel_up]
connect_bd_net [get_bd_pins aurora_x1y4_1/gt_pll_lock] [get_bd_pins x1y4_core_status_1/probe_in1]
connect_bd_net [get_bd_pins aurora_x1y4_1/lane_up] [get_bd_pins x1y4_core_status_1/probe_in2]
connect_bd_net [get_bd_pins aurora_x1y4_1/sys_reset_out] [get_bd_pins aurora_rstn_1/system_rst]
connect_bd_net [get_bd_pins auto_reset_aurora/reset_pb] [get_bd_pins aurora_x1y4_0/reset_pb]
connect_bd_net [get_bd_pins init_clk] [get_bd_pins aurora_x1y4_1/init_clk] [get_bd_pins aurora_x1y4_0/init_clk] [get_bd_pins auto_reset_aurora/i_clk]
connect_bd_net [get_bd_pins pma_init] [get_bd_pins aurora_x1y4_0/pma_init]

current_bd_instance /hier_x1y8
connect_bd_intf_net [get_bd_intf_pins GT_REFCLK] [get_bd_intf_pins aurora_x1y8_0/GT_DIFF_REFCLK1]
connect_bd_intf_net [get_bd_intf_pins GT_SERIAL_RX_C0] [get_bd_intf_pins aurora_x1y8_0/GT_SERIAL_RX]
connect_bd_intf_net [get_bd_intf_pins GT_SERIAL_RX_C1] [get_bd_intf_pins aurora_x1y8_1/GT_SERIAL_RX]
connect_bd_intf_net [get_bd_intf_pins S_AXIS_TX_C0] [get_bd_intf_pins aurora_x1y8_0/USER_DATA_S_AXIS_TX]
connect_bd_intf_net [get_bd_intf_pins S_AXIS_TX_C1] [get_bd_intf_pins aurora_x1y8_1/USER_DATA_S_AXIS_TX]
connect_bd_intf_net [get_bd_intf_pins GT_SERIAL_TX_C0] [get_bd_intf_pins aurora_x1y8_0/GT_SERIAL_TX]
connect_bd_intf_net [get_bd_intf_pins M_AXIS_RX_C0] [get_bd_intf_pins aurora_x1y8_0/USER_DATA_M_AXIS_RX]
connect_bd_intf_net [get_bd_intf_pins GT_SERIAL_TX_C1] [get_bd_intf_pins aurora_x1y8_1/GT_SERIAL_TX]
connect_bd_intf_net [get_bd_intf_pins M_AXIS_RX_C1] [get_bd_intf_pins aurora_x1y8_1/USER_DATA_M_AXIS_RX]
connect_bd_net [get_bd_pins aurora_rstn_0/arstn] [get_bd_pins arstn_c0]
connect_bd_net [get_bd_pins aurora_rstn_1/arstn] [get_bd_pins arstn_c1]
connect_bd_net [get_bd_pins aurora_x1y8_0/channel_up] [get_bd_pins x1y8_core_status_0/probe_in0] [get_bd_pins aurora_rstn_0/channel_up]
connect_bd_net [get_bd_pins aurora_x1y8_0/gt_pll_lock] [get_bd_pins x1y8_core_status_0/probe_in1] [get_bd_pins auto_reset_aurora/pll_lock]
connect_bd_net [get_bd_pins aurora_x1y8_0/gt_qpllclk_quad1_out] [get_bd_pins aurora_x1y8_1/gt_qpllclk_quad1_in]
connect_bd_net [get_bd_pins aurora_x1y8_0/gt_qplllock_quad1_out] [get_bd_pins aurora_x1y8_1/gt_qplllock_quad1_in]
connect_bd_net [get_bd_pins aurora_x1y8_0/gt_qpllrefclk_quad1_out] [get_bd_pins aurora_x1y8_1/gt_qpllrefclk_quad1_in]
connect_bd_net [get_bd_pins aurora_x1y8_0/gt_qpllrefclklost_quad1_out] [get_bd_pins aurora_x1y8_1/gt_qpllrefclklost_quad1]
connect_bd_net [get_bd_pins aurora_x1y8_0/gt_refclk1_out] [get_bd_pins aurora_x1y8_1/refclk1_in]
connect_bd_net [get_bd_pins aurora_x1y8_0/gt_reset_out] [get_bd_pins aurora_x1y8_1/pma_init]
connect_bd_net [get_bd_pins aurora_x1y8_0/lane_up] [get_bd_pins x1y8_core_status_0/probe_in2]
connect_bd_net [get_bd_pins aurora_x1y8_0/mmcm_not_locked_out] [get_bd_pins aurora_x1y8_1/mmcm_not_locked]
connect_bd_net [get_bd_pins aurora_x1y8_0/sync_clk_out] [get_bd_pins aurora_x1y8_1/sync_clk]
connect_bd_net [get_bd_pins aurora_x1y8_0/sys_reset_out] [get_bd_pins aurora_x1y8_1/reset_pb] [get_bd_pins aurora_rstn_0/system_rst]
connect_bd_net [get_bd_pins aurora_x1y8_0/user_clk_out] \
  [get_bd_pins user_clk_out] [get_bd_pins x1y8_core_status_0/clk] [get_bd_pins x1y8_core_status_1/clk] \
  [get_bd_pins aurora_x1y8_1/user_clk]
connect_bd_net [get_bd_pins aurora_x1y8_1/channel_up] [get_bd_pins x1y8_core_status_1/probe_in0] [get_bd_pins aurora_rstn_1/channel_up]
connect_bd_net [get_bd_pins aurora_x1y8_1/gt_pll_lock] [get_bd_pins x1y8_core_status_1/probe_in1]
connect_bd_net [get_bd_pins aurora_x1y8_1/lane_up] [get_bd_pins x1y8_core_status_1/probe_in2]
connect_bd_net [get_bd_pins aurora_x1y8_1/sys_reset_out] [get_bd_pins aurora_rstn_1/system_rst]
connect_bd_net [get_bd_pins auto_reset_aurora/reset_pb] [get_bd_pins aurora_x1y8_0/reset_pb]
connect_bd_net [get_bd_pins init_clk] [get_bd_pins aurora_x1y8_1/init_clk] [get_bd_pins aurora_x1y8_0/init_clk] [get_bd_pins auto_reset_aurora/i_clk]
connect_bd_net [get_bd_pins pma_init] [get_bd_pins aurora_x1y8_0/pma_init]

current_bd_instance /hier_x1y9
connect_bd_intf_net [get_bd_intf_pins GT_REFCLK] [get_bd_intf_pins aurora_x1y9_0/GT_DIFF_REFCLK1]
connect_bd_intf_net [get_bd_intf_pins GT_SERIAL_RX_C0] [get_bd_intf_pins aurora_x1y9_0/GT_SERIAL_RX]
connect_bd_intf_net [get_bd_intf_pins GT_SERIAL_RX_C1] [get_bd_intf_pins aurora_x1y9_1/GT_SERIAL_RX]
connect_bd_intf_net [get_bd_intf_pins S_AXIS_TX_C0] [get_bd_intf_pins aurora_x1y9_0/USER_DATA_S_AXIS_TX]
connect_bd_intf_net [get_bd_intf_pins S_AXIS_TX_C1] [get_bd_intf_pins aurora_x1y9_1/USER_DATA_S_AXIS_TX]
connect_bd_intf_net [get_bd_intf_pins GT_SERIAL_TX_C0] [get_bd_intf_pins aurora_x1y9_0/GT_SERIAL_TX]
connect_bd_intf_net [get_bd_intf_pins M_AXIS_RX_C0] [get_bd_intf_pins aurora_x1y9_0/USER_DATA_M_AXIS_RX]
connect_bd_intf_net [get_bd_intf_pins GT_SERIAL_TX_C1] [get_bd_intf_pins aurora_x1y9_1/GT_SERIAL_TX]
connect_bd_intf_net [get_bd_intf_pins M_AXIS_RX_C1] [get_bd_intf_pins aurora_x1y9_1/USER_DATA_M_AXIS_RX]
connect_bd_net [get_bd_pins aurora_rstn_0/arstn] [get_bd_pins arstn_c0]
connect_bd_net [get_bd_pins aurora_rstn_1/arstn] [get_bd_pins arstn_c1]
connect_bd_net [get_bd_pins aurora_x1y9_0/channel_up] [get_bd_pins x1y9_core_status_0/probe_in0] [get_bd_pins aurora_rstn_0/channel_up]
connect_bd_net [get_bd_pins aurora_x1y9_0/gt_pll_lock] [get_bd_pins x1y9_core_status_0/probe_in1] [get_bd_pins auto_reset_aurora/pll_lock]
connect_bd_net [get_bd_pins aurora_x1y9_0/gt_qpllclk_quad1_out] [get_bd_pins aurora_x1y9_1/gt_qpllclk_quad1_in]
connect_bd_net [get_bd_pins aurora_x1y9_0/gt_qplllock_quad1_out] [get_bd_pins aurora_x1y9_1/gt_qplllock_quad1_in]
connect_bd_net [get_bd_pins aurora_x1y9_0/gt_qpllrefclk_quad1_out] [get_bd_pins aurora_x1y9_1/gt_qpllrefclk_quad1_in]
connect_bd_net [get_bd_pins aurora_x1y9_0/gt_qpllrefclklost_quad1_out] [get_bd_pins aurora_x1y9_1/gt_qpllrefclklost_quad1]
connect_bd_net [get_bd_pins aurora_x1y9_0/gt_refclk1_out] [get_bd_pins aurora_x1y9_1/refclk1_in]
connect_bd_net [get_bd_pins aurora_x1y9_0/gt_reset_out] [get_bd_pins aurora_x1y9_1/pma_init]
connect_bd_net [get_bd_pins aurora_x1y9_0/lane_up] [get_bd_pins x1y9_core_status_0/probe_in2]
connect_bd_net [get_bd_pins aurora_x1y9_0/mmcm_not_locked_out] [get_bd_pins aurora_x1y9_1/mmcm_not_locked]
connect_bd_net [get_bd_pins aurora_x1y9_0/sync_clk_out] [get_bd_pins aurora_x1y9_1/sync_clk]
connect_bd_net [get_bd_pins aurora_x1y9_0/sys_reset_out] [get_bd_pins aurora_x1y9_1/reset_pb] [get_bd_pins aurora_rstn_0/system_rst]
connect_bd_net [get_bd_pins aurora_x1y9_0/user_clk_out] \
  [get_bd_pins user_clk_out] [get_bd_pins x1y9_core_status_0/clk] [get_bd_pins x1y9_core_status_1/clk] \
  [get_bd_pins aurora_x1y9_1/user_clk]
connect_bd_net [get_bd_pins aurora_x1y9_1/channel_up] [get_bd_pins x1y9_core_status_1/probe_in0] [get_bd_pins aurora_rstn_1/channel_up]
connect_bd_net [get_bd_pins aurora_x1y9_1/gt_pll_lock] [get_bd_pins x1y9_core_status_1/probe_in1]
connect_bd_net [get_bd_pins aurora_x1y9_1/lane_up] [get_bd_pins x1y9_core_status_1/probe_in2]
connect_bd_net [get_bd_pins aurora_x1y9_1/sys_reset_out] [get_bd_pins aurora_rstn_1/system_rst]
connect_bd_net [get_bd_pins auto_reset_aurora/reset_pb] [get_bd_pins aurora_x1y9_0/reset_pb]
connect_bd_net [get_bd_pins init_clk] [get_bd_pins aurora_x1y9_1/init_clk] [get_bd_pins aurora_x1y9_0/init_clk] [get_bd_pins auto_reset_aurora/i_clk]
connect_bd_net [get_bd_pins pma_init] [get_bd_pins aurora_x1y9_0/pma_init]

current_bd_instance /hier_x1y10
connect_bd_intf_net [get_bd_intf_pins GT_REFCLK] [get_bd_intf_pins aurora_x1y10_0/GT_DIFF_REFCLK1]
connect_bd_intf_net [get_bd_intf_pins GT_SERIAL_RX_C0] [get_bd_intf_pins aurora_x1y10_0/GT_SERIAL_RX]
connect_bd_intf_net [get_bd_intf_pins GT_SERIAL_RX_C1] [get_bd_intf_pins aurora_x1y10_1/GT_SERIAL_RX]
connect_bd_intf_net [get_bd_intf_pins S_AXIS_TX_C0] [get_bd_intf_pins aurora_x1y10_0/USER_DATA_S_AXIS_TX]
connect_bd_intf_net [get_bd_intf_pins S_AXIS_TX_C1] [get_bd_intf_pins aurora_x1y10_1/USER_DATA_S_AXIS_TX]
connect_bd_intf_net [get_bd_intf_pins GT_SERIAL_TX_C0] [get_bd_intf_pins aurora_x1y10_0/GT_SERIAL_TX]
connect_bd_intf_net [get_bd_intf_pins M_AXIS_RX_C0] [get_bd_intf_pins aurora_x1y10_0/USER_DATA_M_AXIS_RX]
connect_bd_intf_net [get_bd_intf_pins GT_SERIAL_TX_C1] [get_bd_intf_pins aurora_x1y10_1/GT_SERIAL_TX]
connect_bd_intf_net [get_bd_intf_pins M_AXIS_RX_C1] [get_bd_intf_pins aurora_x1y10_1/USER_DATA_M_AXIS_RX]
connect_bd_net [get_bd_pins aurora_rstn_0/arstn] [get_bd_pins arstn_c0]
connect_bd_net [get_bd_pins aurora_rstn_1/arstn] [get_bd_pins arstn_c1]
connect_bd_net [get_bd_pins aurora_x1y10_0/channel_up] [get_bd_pins x1y10_core_status_0/probe_in0] [get_bd_pins aurora_rstn_0/channel_up]
connect_bd_net [get_bd_pins aurora_x1y10_0/gt_pll_lock] [get_bd_pins x1y10_core_status_0/probe_in1] [get_bd_pins auto_reset_aurora/pll_lock]
connect_bd_net [get_bd_pins aurora_x1y10_0/gt_qpllclk_quad1_out] [get_bd_pins aurora_x1y10_1/gt_qpllclk_quad1_in]
connect_bd_net [get_bd_pins aurora_x1y10_0/gt_qplllock_quad1_out] [get_bd_pins aurora_x1y10_1/gt_qplllock_quad1_in]
connect_bd_net [get_bd_pins aurora_x1y10_0/gt_qpllrefclk_quad1_out] [get_bd_pins aurora_x1y10_1/gt_qpllrefclk_quad1_in]
connect_bd_net [get_bd_pins aurora_x1y10_0/gt_qpllrefclklost_quad1_out] [get_bd_pins aurora_x1y10_1/gt_qpllrefclklost_quad1]
connect_bd_net [get_bd_pins aurora_x1y10_0/gt_refclk1_out] [get_bd_pins aurora_x1y10_1/refclk1_in]
connect_bd_net [get_bd_pins aurora_x1y10_0/gt_reset_out] [get_bd_pins aurora_x1y10_1/pma_init]
connect_bd_net [get_bd_pins aurora_x1y10_0/lane_up] [get_bd_pins x1y10_core_status_0/probe_in2]
connect_bd_net [get_bd_pins aurora_x1y10_0/mmcm_not_locked_out] [get_bd_pins aurora_x1y10_1/mmcm_not_locked]
connect_bd_net [get_bd_pins aurora_x1y10_0/sync_clk_out] [get_bd_pins aurora_x1y10_1/sync_clk]
connect_bd_net [get_bd_pins aurora_x1y10_0/sys_reset_out] [get_bd_pins aurora_x1y10_1/reset_pb] [get_bd_pins aurora_rstn_0/system_rst]
connect_bd_net [get_bd_pins aurora_x1y10_0/user_clk_out] \
  [get_bd_pins user_clk_out] [get_bd_pins x1y10_core_status_0/clk] [get_bd_pins x1y10_core_status_1/clk] \
  [get_bd_pins aurora_x1y10_1/user_clk]
connect_bd_net [get_bd_pins aurora_x1y10_1/channel_up] [get_bd_pins x1y10_core_status_1/probe_in0] [get_bd_pins aurora_rstn_1/channel_up]
connect_bd_net [get_bd_pins aurora_x1y10_1/gt_pll_lock] [get_bd_pins x1y10_core_status_1/probe_in1]
connect_bd_net [get_bd_pins aurora_x1y10_1/lane_up] [get_bd_pins x1y10_core_status_1/probe_in2]
connect_bd_net [get_bd_pins aurora_x1y10_1/sys_reset_out] [get_bd_pins aurora_rstn_1/system_rst]
connect_bd_net [get_bd_pins auto_reset_aurora/reset_pb] [get_bd_pins aurora_x1y10_0/reset_pb]
connect_bd_net [get_bd_pins init_clk] \
  [get_bd_pins aurora_x1y10_1/init_clk] [get_bd_pins aurora_x1y10_0/init_clk] [get_bd_pins auto_reset_aurora/i_clk]
connect_bd_net [get_bd_pins pma_init] [get_bd_pins aurora_x1y10_0/pma_init]

current_bd_instance /hier_x1y11
connect_bd_intf_net [get_bd_intf_pins GT_REFCLK] [get_bd_intf_pins aurora_x1y11_0/GT_DIFF_REFCLK1]
connect_bd_intf_net [get_bd_intf_pins GT_SERIAL_RX_C0] [get_bd_intf_pins aurora_x1y11_0/GT_SERIAL_RX]
connect_bd_intf_net [get_bd_intf_pins GT_SERIAL_RX_C1] [get_bd_intf_pins aurora_x1y11_1/GT_SERIAL_RX]
connect_bd_intf_net [get_bd_intf_pins S_AXIS_TX_C0] [get_bd_intf_pins aurora_x1y11_0/USER_DATA_S_AXIS_TX]
connect_bd_intf_net [get_bd_intf_pins S_AXIS_TX_C1] [get_bd_intf_pins aurora_x1y11_1/USER_DATA_S_AXIS_TX]
connect_bd_intf_net [get_bd_intf_pins GT_SERIAL_TX_C0] [get_bd_intf_pins aurora_x1y11_0/GT_SERIAL_TX]
connect_bd_intf_net [get_bd_intf_pins M_AXIS_RX_C0] [get_bd_intf_pins aurora_x1y11_0/USER_DATA_M_AXIS_RX]
connect_bd_intf_net [get_bd_intf_pins GT_SERIAL_TX_C1] [get_bd_intf_pins aurora_x1y11_1/GT_SERIAL_TX]
connect_bd_intf_net [get_bd_intf_pins M_AXIS_RX_C1] [get_bd_intf_pins aurora_x1y11_1/USER_DATA_M_AXIS_RX]
connect_bd_net [get_bd_pins aurora_rstn_0/arstn] [get_bd_pins arstn_c0]
connect_bd_net [get_bd_pins aurora_rstn_1/arstn] [get_bd_pins arstn_c1]
connect_bd_net [get_bd_pins aurora_x1y11_0/channel_up] [get_bd_pins x1y11_core_status_0/probe_in0] [get_bd_pins aurora_rstn_0/channel_up]
connect_bd_net [get_bd_pins aurora_x1y11_0/gt_pll_lock] [get_bd_pins x1y11_core_status_0/probe_in1] [get_bd_pins auto_reset_aurora/pll_lock]
connect_bd_net [get_bd_pins aurora_x1y11_0/gt_qpllclk_quad1_out] [get_bd_pins aurora_x1y11_1/gt_qpllclk_quad1_in]
connect_bd_net [get_bd_pins aurora_x1y11_0/gt_qplllock_quad1_out] [get_bd_pins aurora_x1y11_1/gt_qplllock_quad1_in]
connect_bd_net [get_bd_pins aurora_x1y11_0/gt_qpllrefclk_quad1_out] [get_bd_pins aurora_x1y11_1/gt_qpllrefclk_quad1_in]
connect_bd_net [get_bd_pins aurora_x1y11_0/gt_qpllrefclklost_quad1_out] [get_bd_pins aurora_x1y11_1/gt_qpllrefclklost_quad1]
connect_bd_net [get_bd_pins aurora_x1y11_0/gt_refclk1_out] [get_bd_pins aurora_x1y11_1/refclk1_in]
connect_bd_net [get_bd_pins aurora_x1y11_0/gt_reset_out] [get_bd_pins aurora_x1y11_1/pma_init]
connect_bd_net [get_bd_pins aurora_x1y11_0/lane_up] [get_bd_pins x1y11_core_status_0/probe_in2]
connect_bd_net [get_bd_pins aurora_x1y11_0/mmcm_not_locked_out] [get_bd_pins aurora_x1y11_1/mmcm_not_locked]
connect_bd_net [get_bd_pins aurora_x1y11_0/sync_clk_out] [get_bd_pins aurora_x1y11_1/sync_clk]
connect_bd_net [get_bd_pins aurora_x1y11_0/sys_reset_out] [get_bd_pins aurora_x1y11_1/reset_pb] [get_bd_pins aurora_rstn_0/system_rst]
connect_bd_net [get_bd_pins aurora_x1y11_0/user_clk_out] \
  [get_bd_pins user_clk_out] [get_bd_pins x1y11_core_status_0/clk] [get_bd_pins x1y11_core_status_1/clk] \
  [get_bd_pins aurora_x1y11_1/user_clk]
connect_bd_net [get_bd_pins aurora_x1y11_1/channel_up] [get_bd_pins x1y11_core_status_1/probe_in0] [get_bd_pins aurora_rstn_1/channel_up]
connect_bd_net [get_bd_pins aurora_x1y11_1/gt_pll_lock] [get_bd_pins x1y11_core_status_1/probe_in1]
connect_bd_net [get_bd_pins aurora_x1y11_1/lane_up] [get_bd_pins x1y11_core_status_1/probe_in2]
connect_bd_net [get_bd_pins aurora_x1y11_1/sys_reset_out] [get_bd_pins aurora_rstn_1/system_rst]
connect_bd_net [get_bd_pins auto_reset_aurora/reset_pb] [get_bd_pins aurora_x1y11_0/reset_pb]
connect_bd_net [get_bd_pins init_clk] \
  [get_bd_pins aurora_x1y11_1/init_clk] [get_bd_pins aurora_x1y11_0/init_clk] [get_bd_pins auto_reset_aurora/i_clk]
connect_bd_net [get_bd_pins pma_init] [get_bd_pins aurora_x1y11_0/pma_init]
